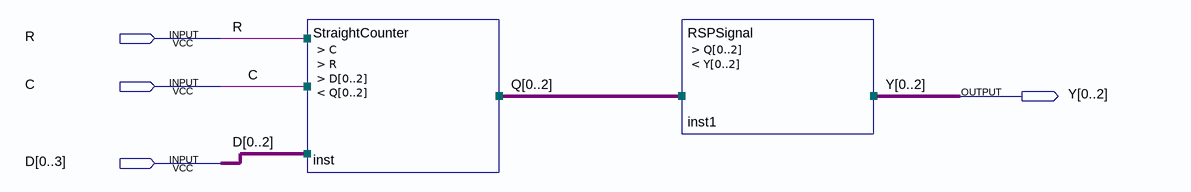
[diagram p0: schematic sheet]
// Quartus schematic lab1.bdf as structural Verilog: 2 symbols, 4 pins
module lab1 (
  input  R,
  input  C,
  input  [0:3] D,
  output [0:2] Y
);

  wire [2:0] Q;

  StraightCounter inst (.C(C), .R(R), .D(D[0:2]), .Q({Q[0], Q[1], Q[2]}));
  RSPSignal inst1 (.Q({Q[0], Q[1], Q[2]}), .Y(Y));
endmodule
